# Altium project PCB_Project.PrjPcb
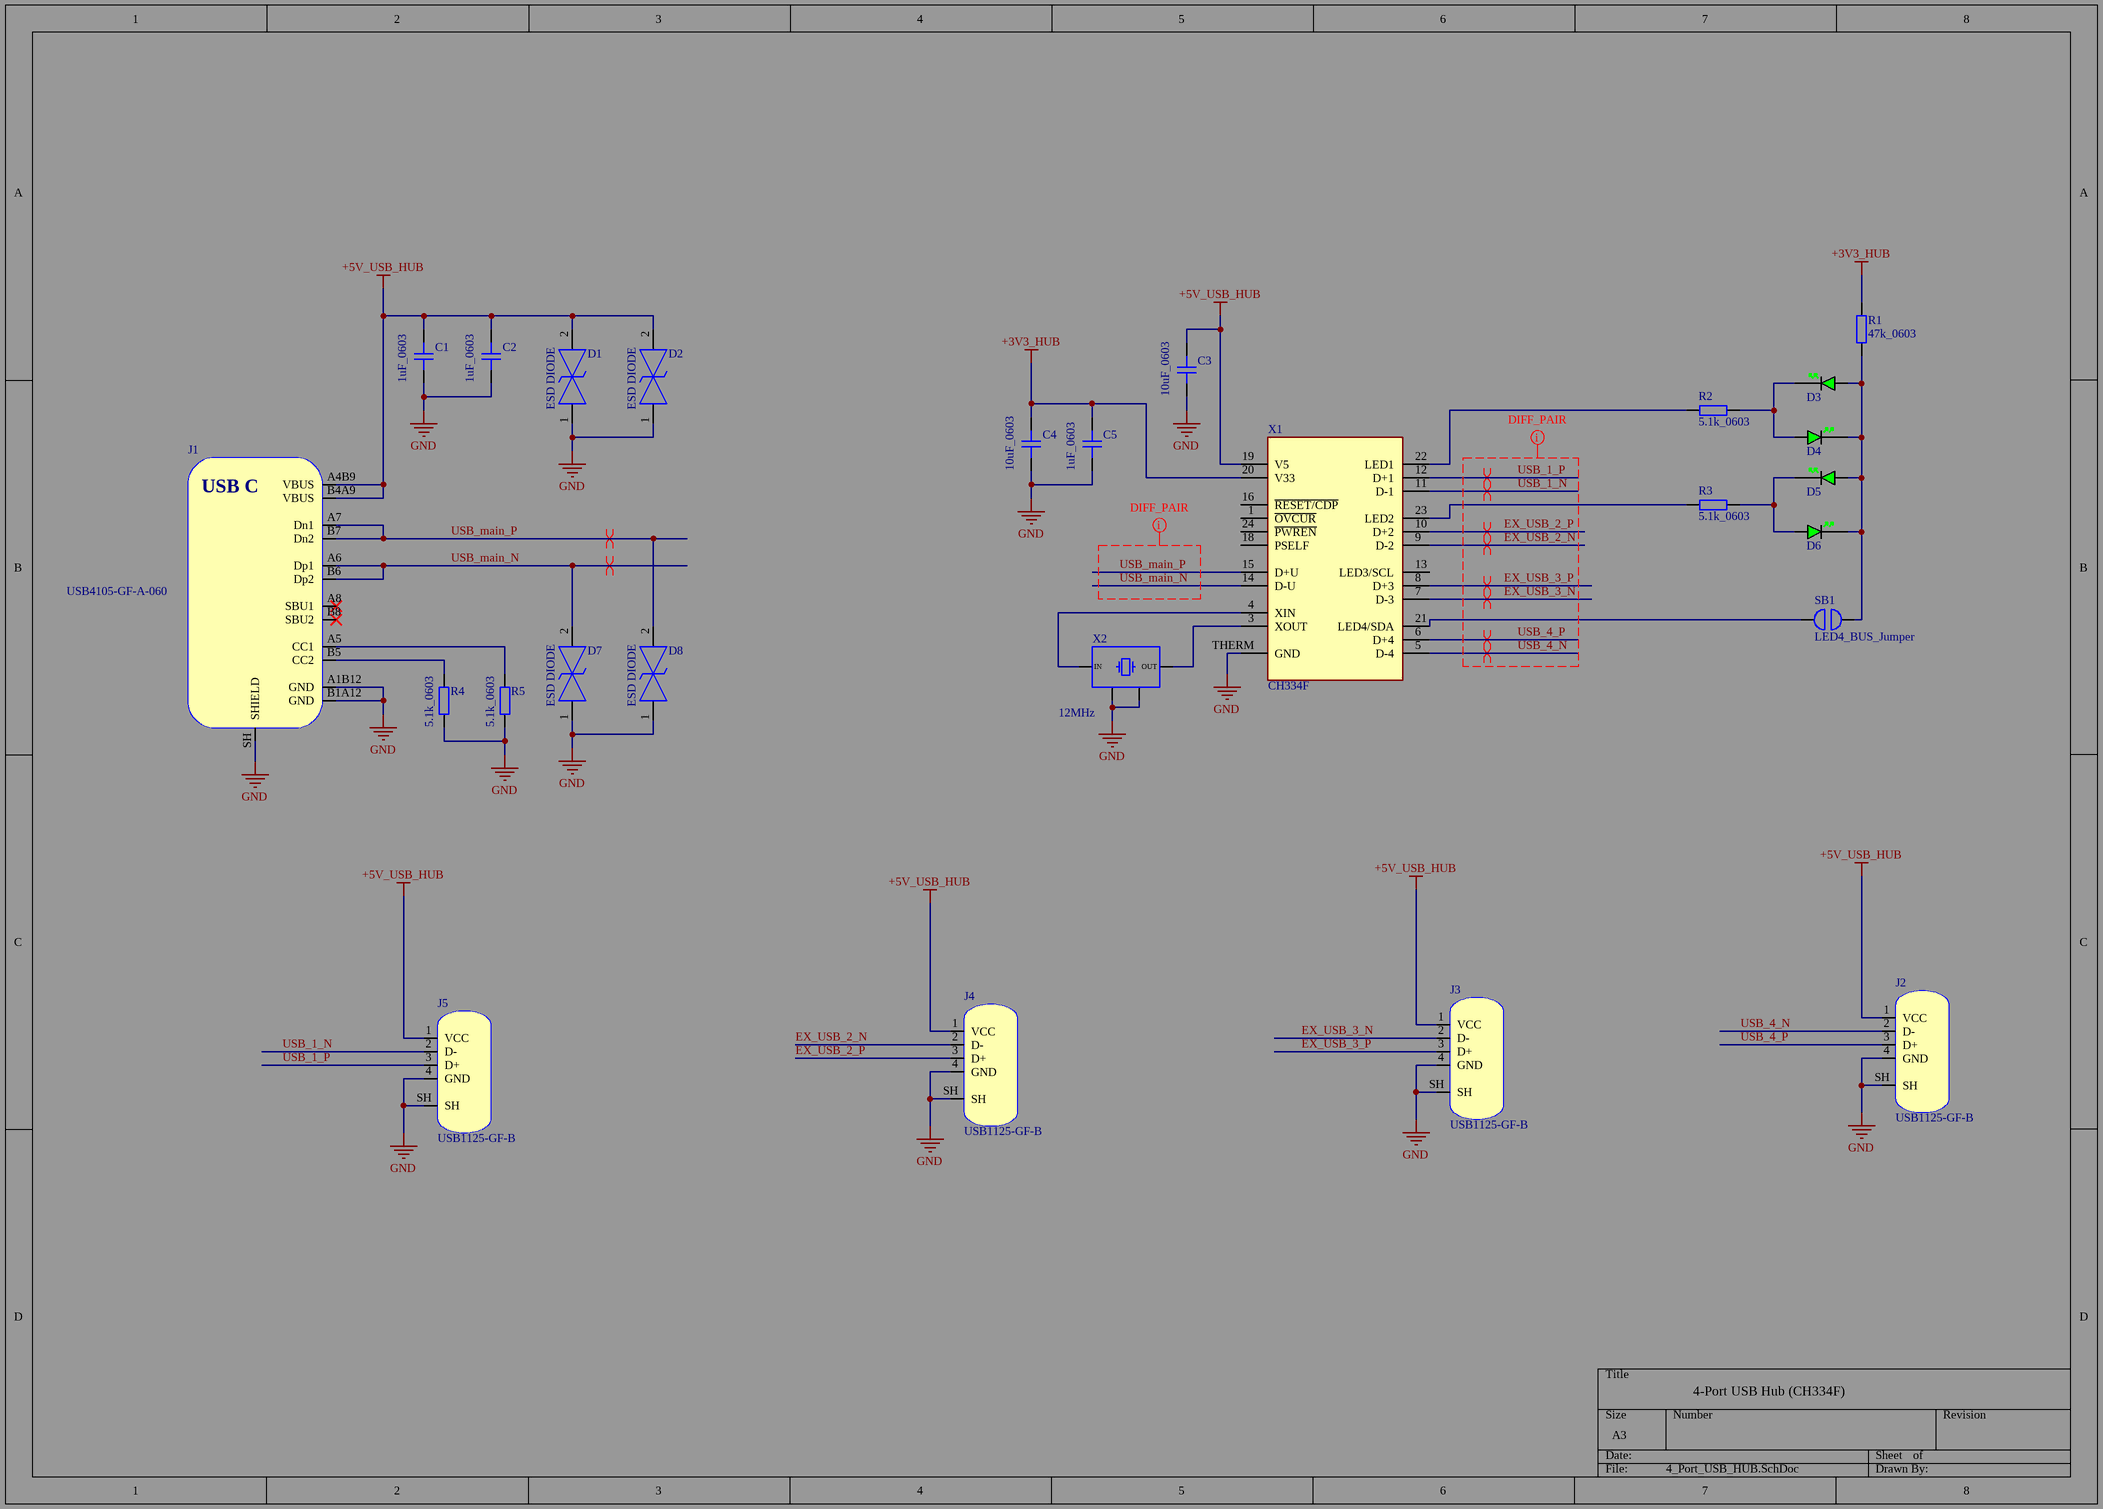
[diagram p0: 4_Port_USB_HUB.SchDoc]
1 sheet, 26 parts. Net scope: global (net labels, ports and power ports of the same name join across sheets).

## Sheet 4_Port_USB_HUB.SchDoc: 4-Port USB Hub (CH334F)
size A3; Author: ERFAN; SheetNumber: 1; SheetTotal: 1

### Parts
C1  1uF_0603  [CAP_0603]
C2  1uF_0603  [CAP_0603]
C3  10uF_0603  [CAP_0603]
C4  10uF_0603  [CAP_0603]
C5  1uF_0603  [CAP_0603]
D1  ESD DIODE  [RES_0603]
D2  ESD DIODE  [RES_0603]
D3  GREEN  [LED_0805_GREEN]  (value not drawn)
D4  GREEN  [LED_0805_GREEN]  (value not drawn)
D5  GREEN  [LED_0805_GREEN]  (value not drawn)
D6  GREEN  [LED_0805_GREEN]  (value not drawn)
D7  ESD DIODE  [RES_0603]
D8  ESD DIODE  [RES_0603]
J1  USB4105-GF-A-060  [USB4105-GF-A-060]
J2  USB1125-GF-B  [USB1125-GF-B]
J3  USB1125-GF-B  [USB1125-GF-B]
J4  USB1125-GF-B  [USB1125-GF-B]
J5  USB1125-GF-B  [USB1125-GF-B]
R1  47k_0603  [RES_0603]
R2  5.1k_0603  [RES_0603]
R3  5.1k_0603  [RES_0603]
R4  5.1k_0603  [RES_0603]
R5  5.1k_0603  [RES_0603]
SB1  LED4_BUS_Jumper  [SB]
X1  CH334F  [QFN24_4MM]
X2  12MHz  [XTAL_3225]

### Nets
+3V3_HUB: C4.2 C5.2 R1.2 X1.20(V33)
+5V_USB_HUB: C1.2 C2.2 C3.2 D1.2 D2.2 J1.A4B9(VBUS) J1.B4A9(VBUS) J2.1(VCC) J3.1(VCC) J4.1(VCC) J5.1(VCC) X1.19(V5)
GND: C1.1 C2.1 C3.1 C4.1 C5.1 D1.1 D2.1 D7.1 D8.1 J1.A1B12(GND) J1.B1A12(GND) J1.SH(SHIELD) J2.4(GND) J2.SH J3.4(GND) J3.SH J4.4(GND) J4.SH J5.4(GND) J5.SH R4.1 R5.1 X1.THERM(GND) X2.2 X2.4
EX_USB_2_N: J4.2(D-) X1.9(D-2)
EX_USB_2_P: J4.3(D+) X1.10(D+2)
EX_USB_3_N: J3.2(D-) X1.7(D-3)
EX_USB_3_P: J3.3(D+) X1.8(D+3)
USB_1_N: J5.2(D-) X1.11(D-1)
USB_1_P: J5.3(D+) X1.12(D+1)
USB_4_N: J2.2(D-) X1.5(D-4)
USB_4_P: J2.3(D+) X1.6(D+4)
USB_main_N: D7.2 J1.A6(Dp1) J1.B6(Dp2) X1.14(D-U)
USB_main_P: D8.2 J1.A7(Dn1) J1.B7(Dn2) X1.15(D+U)
NetD3_A: D3.A D4.K D5.A D6.K R1.1 SB1.2
NetD3_K: D3.K D4.A R2.1
NetD5_K: D5.K D6.A R3.1
NetJ1_A5: J1.A5(CC1) R5.2
NetJ1_B5: J1.B5(CC2) R4.2
NetR2_2: R2.2 X1.22(LED1)
NetR3_2: R3.2 X1.23(LED2)
NetSB1_1: SB1.1 X1.21(LED4/SDA)
NetX1_3: X1.3(XOUT) X2.3
NetX1_4: X1.4(XIN) X2.1

Not connected (* = marked no-connect by the designer): J1 A8(SBU1)* B8(SBU2)*; X1 1(~{OVCUR}) 13(LED3/SCL) 16(~{RESET/CDP}) 18(PSELF) 24(~{PWREN})

### Layout directives
differential pair; differential pair class DIFF_90: EX_USB_2_N, EX_USB_2_P, EX_USB_3_N, EX_USB_3_P, USB_1_N, USB_1_P, USB_4_N, USB_4_P, USB_main_N, USB_main_P
net class DIFF_90: EX_USB_2_N, EX_USB_2_P, EX_USB_3_N, EX_USB_3_P, USB_1_N, USB_1_P, USB_4_N, USB_4_P, USB_main_N, USB_main_P

### Notes on the sheet
- 4-Port USB Hub (CH334F)
- (in symbol USB4105-GF-A-060) USB C
- (in symbol XTAL_3225) IN; OUT

### Library data of the parts
C1 C2 C5 = CAP_0603_1uF: CAP CER 1uF 25V X5R 0603; Manufacturer: *; Manufacturer Part Number: *; Distributor Link: *; LCSC part number: C29936; Rating: *; Dielectric: *
C3 C4 = CAP_0603_10uF: 10uF ±20% 6.3V Ceramic Capacitor X5R 0603; Manufacturer: *; Manufacturer Part Number: *; Distributor Link: *; LCSC part number: C1691; Rating: *; Dielectric: *
D1 D2 D7 D8 = ESD_diode_0603: ESD DIODE 24VWM 100VC 0603; LCSC part number: C5355505
D3-D6 = LED_0805_GREEN: LED 0805 GREEN SMD; Manufacturer: *; Manufacturer Part Number: *; Distributor Link: *; LCSC part number: C2971978
J1 = USB4105-GF-A-060: USB Connector Type C SMT 12 Pin; Manufacturer: GCT; Manufacturer Part Number: USB4105-GF-A-060; Distributor Link: https://eu.mouser.com/ProductDetail/GCT/USB4105-GF-A-060?qs=QNEnbhJQKvY2mocwNJzgfA%3D%3D; LCSC part number: C5178539
J2-J5 = USB1125-GF-B: USB Connector Type A 2.0 Through-Hole; Manufacturer: GCT; Manufacturer Part Number: USB1125-GF-B; LCSC part number: C2345
R1 = RES_0603_47k: 47kΩ ±5% 100mW 0603 Thick Film Resistor; LCSC part number: C2907173
R2-R5 = RES_0603_5.1k: RES 5.1kΩ ±1% 125mW 0603; LCSC part number: C23186
SB1 = SB
X1 = CH334F: Quad side leadless 24-pin; MF: WCH; SnapEDA_Link: https://www.snapeda.com/parts/CH334F/WCH/view-part/?ref=snap; Package: Package; Value: *; MP: CH334F; Check_prices: https://www.snapeda.com/parts/CH334F/WCH/view-part/?ref=eda; LCSC part number: C5187527
X2 = XTAL_3225: CRYSTAL 12MHz 20pF SMD; Distributor Link: *; LCSC part number: C9002